# Altium schematic sheet Motor_Driver_Sheet4.SchDoc (part 1 of 2)
size 420 x 297 mm; SheetNumber: 24; SheetTotal: 26
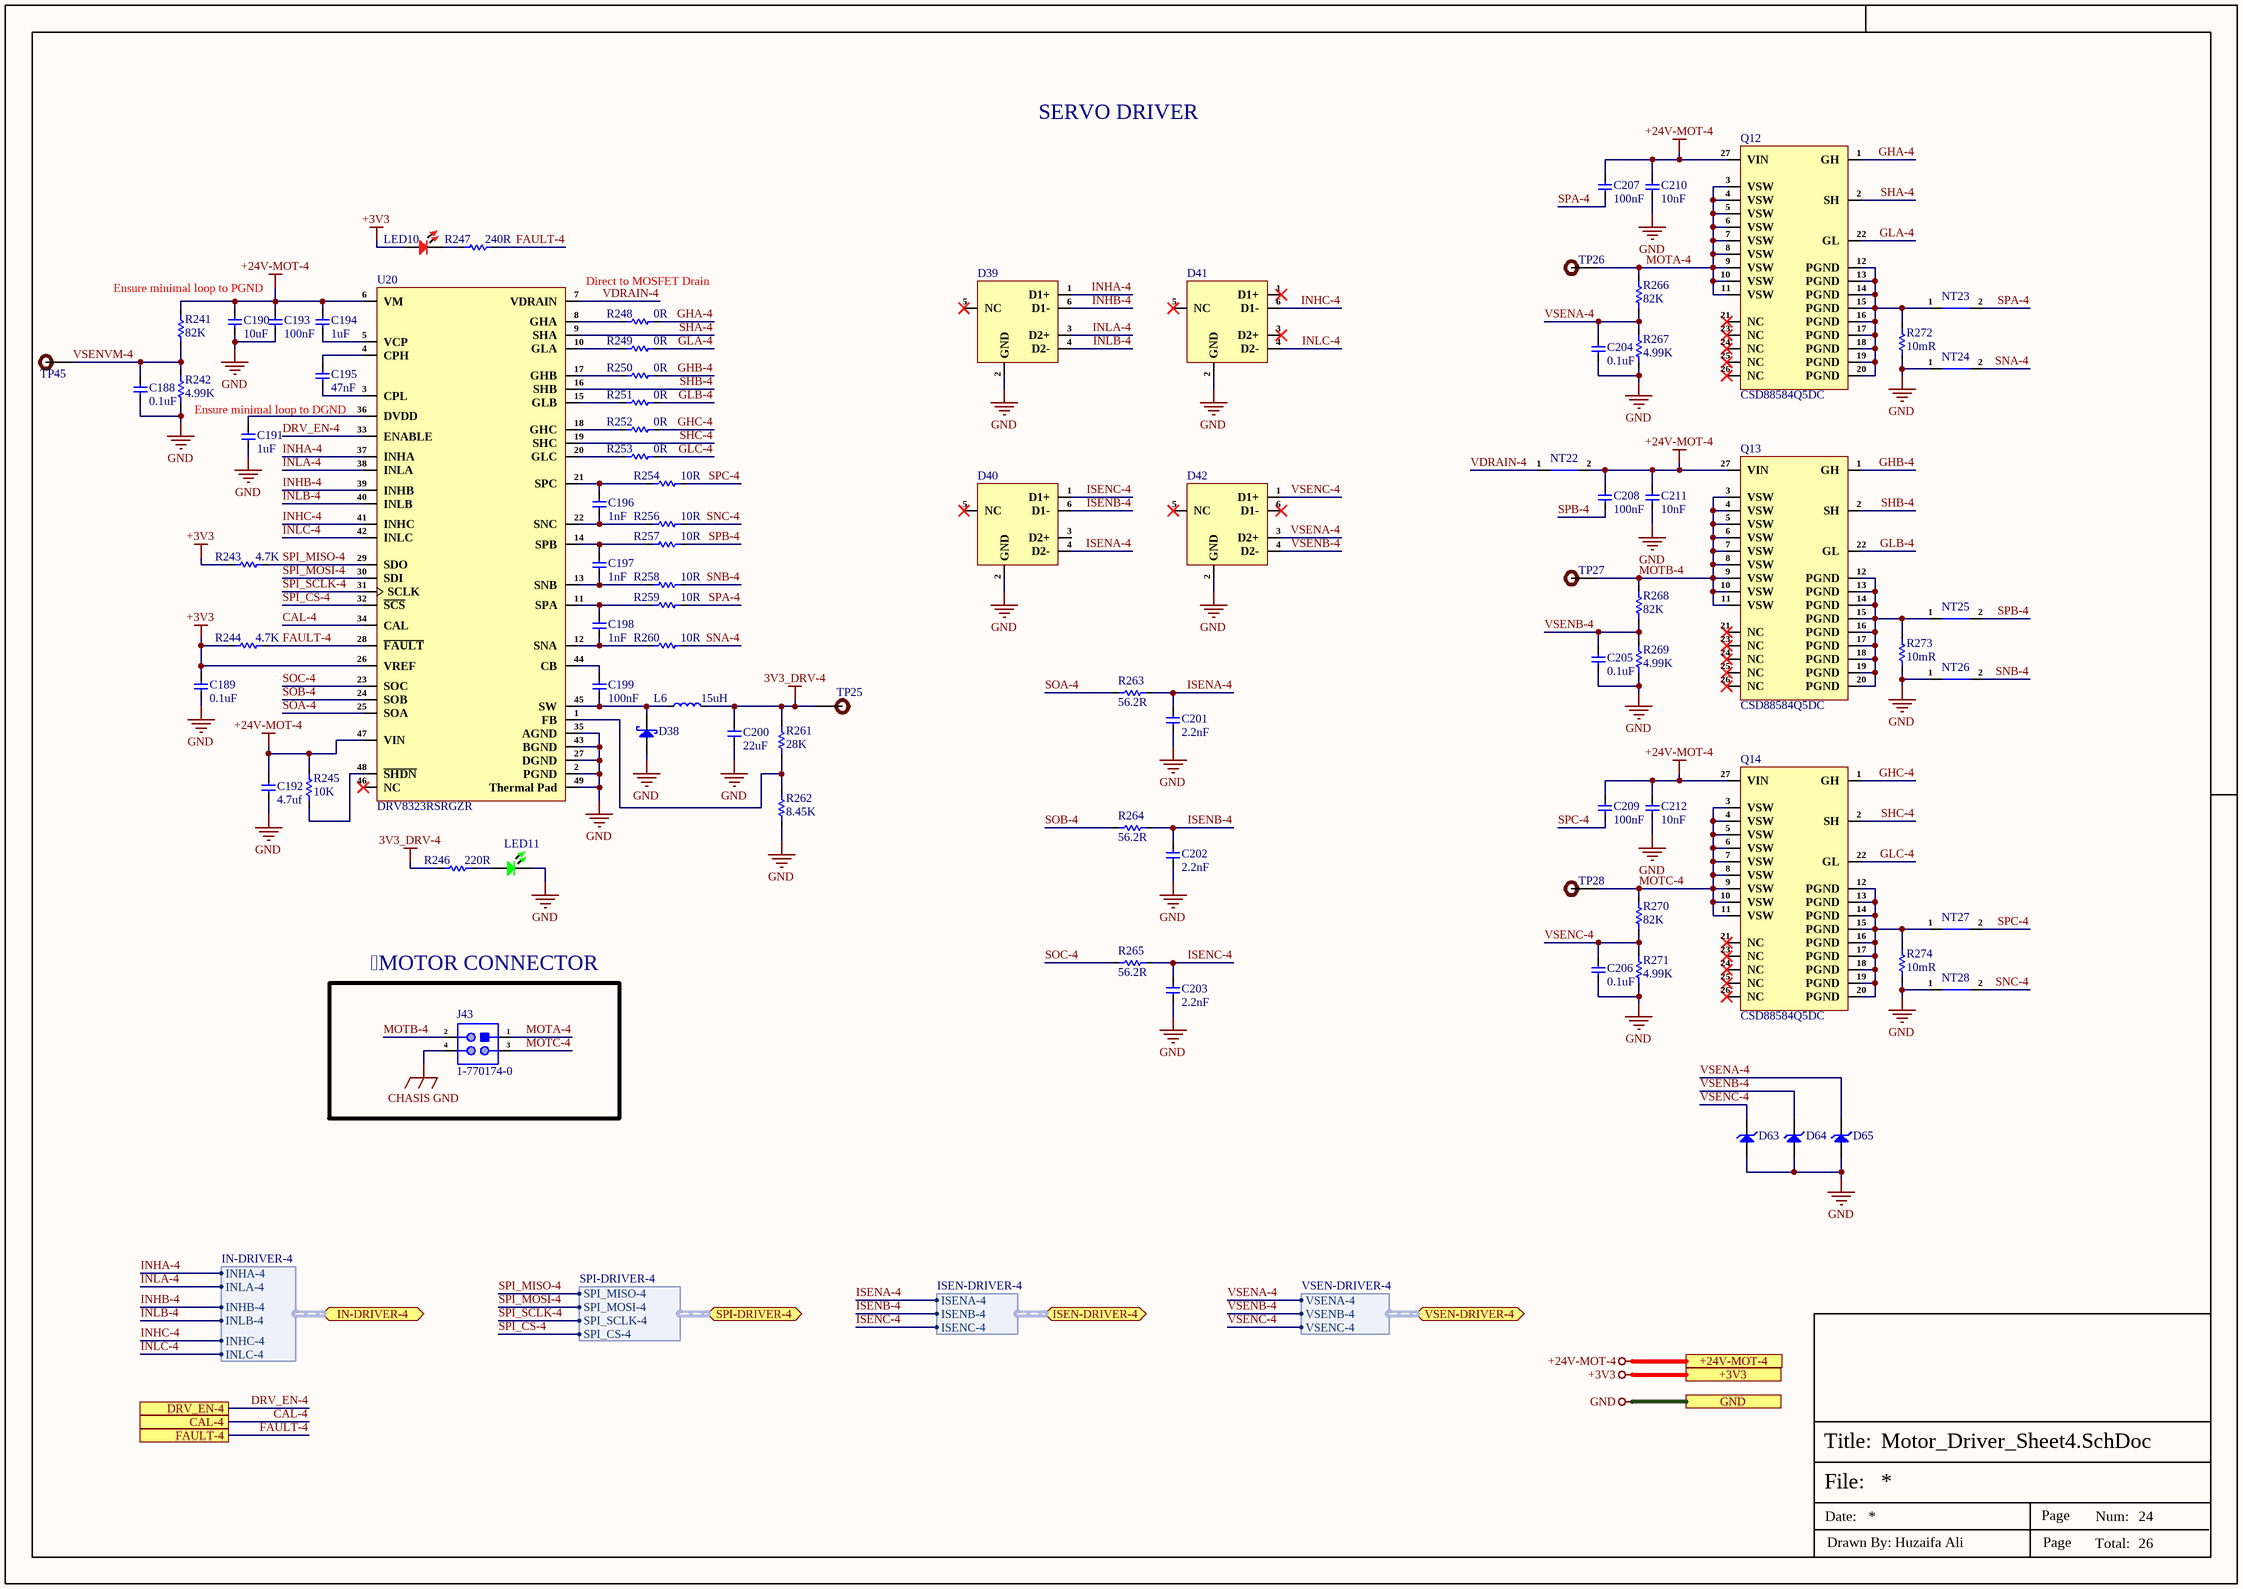
[diagram p0: Motor_Driver_Sheet4.SchDoc]

## Parts
C188  0.1uF  [Cap-0402]
C189  0.1uF  [Cap-0402]
C190  10uF  [Cap-1206]
C191  1uF  [Cap-0603]
C192  4.7uf  [Cap-0805]
C193  100nF  [Cap-0603]
C194  1uF  [Cap-0603]
C195  47nF  [Cap-0402]
C196  1nF  [Cap-0402]
C197  1nF  [Cap-0402]
C198  1nF  [Cap-0402]
C199  100nF  [Cap-0603]
C200  22uF  [Cap-0603]
C201  2.2nF  [Cap-0603]
C202  2.2nF  [Cap-0603]
C203  2.2nF  [Cap-0603]
C204  0.1uF  [Cap-0402]
C205  0.1uF  [Cap-0402]
C206  0.1uF  [Cap-0402]
C207  100nF  [Cap-0603]
C208  100nF  [Cap-0603]
C209  100nF  [Cap-0603]
C210  10nF  [Cap-0402]
C211  10nF  [Cap-0402]
C212  10nF  [Cap-0402]
D38  SS24A  [SMA]  (value not drawn)
D39  TPD4E1U06DCKR  [SOT-363]  (value not drawn)
D40  TPD4E1U06DCKR  [SOT-363]  (value not drawn)
D41  TPD4E1U06DCKR  [SOT-363]  (value not drawn)
D42  TPD4E1U06DCKR  [SOT-363]  (value not drawn)
D63  MM3Z3V3B  [SOD323F]  (value not drawn)
D64  MM3Z3V3B  [SOD323F]  (value not drawn)
D65  MM3Z3V3B  [SOD323F]  (value not drawn)
J43  1-770174-0  [1-770174-0]
L6  15uH  [FEXL0550A-150M]
LED10  RED  [LED-0603]  (value not drawn)
LED11  Emerald  [LED-0603]  (value not drawn)
NT22  Net Tie_SMD  [Net Tie Pad]  (value not drawn)  (net tie, no BOM)
NT23  Net Tie_SMD  [Net Tie Pad]  (value not drawn)  (net tie, no BOM)
NT24  Net Tie_SMD  [Net Tie Pad]  (value not drawn)  (net tie, no BOM)
NT25  Net Tie_SMD  [Net Tie Pad]  (value not drawn)  (net tie, no BOM)
NT26  Net Tie_SMD  [Net Tie Pad]  (value not drawn)  (net tie, no BOM)
NT27  Net Tie_SMD  [Net Tie Pad]  (value not drawn)  (net tie, no BOM)
NT28  Net Tie_SMD  [Net Tie Pad]  (value not drawn)  (net tie, no BOM)
Q12  CSD88584Q5DC  [22-VSON-CLIP (5x6)]
Q13  CSD88584Q5DC  [22-VSON-CLIP (5x6)]
Q14  CSD88584Q5DC  [22-VSON-CLIP (5x6)]
R241  82K  [Res-0603]
R242  4.99K  [Res-0603]
R243  4.7K  [Res-0402]
R244  4.7K  [Res-0402]
R245  10K  [Res-0402]
R246  220R  [Res-0603]
R247  240R  [Res-0402]
R248  0R  [Res-0402]
R249  0R  [Res-0402]
R250  0R  [Res-0402]
R251  0R  [Res-0402]
R252  0R  [Res-0402]
R253  0R  [Res-0402]
R254  10R  [Res-0603]
R256  10R  [Res-0603]
R257  10R  [Res-0603]
R258  10R  [Res-0603]
R259  10R  [Res-0603]
R260  10R  [Res-0603]
R261  28K  [Res-0402]
R262  8.45K  [Res-0402]
R263  56.2R  [Res-0603]
R264  56.2R  [Res-0603]
R265  56.2R  [Res-0603]
R266  82K  [Res-0603]
R267  4.99K  [Res-0603]
R268  82K  [Res-0603]
R269  4.99K  [Res-0603]
R270  82K  [Res-0603]
R271  4.99K  [Res-0603]
R272  10mR  [RES-2512]
R273  10mR  [RES-2512]
R274  10mR  [RES-2512]
TP25  TEST POINT 0.5mm Dia  [Test-point - 0.5mm]  (value not drawn)  (no BOM)
TP26  TEST POINT 0.5mm Dia  [Test-point - 0.5mm]  (value not drawn)  (no BOM)
TP27  TEST POINT 0.5mm Dia  [Test-point - 0.5mm]  (value not drawn)  (no BOM)
TP28  TEST POINT 0.5mm Dia  [Test-point - 0.5mm]  (value not drawn)  (no BOM)
TP45  TEST POINT 0.5mm Dia  [Test-point - 0.5mm]  (value not drawn)  (no BOM)
U20  DRV8323RSRGZR  [48-VQFN (7x7)]

## Ports
+3V3 (see Servo4[2B], CAN_Sheet[4D], Controller_Sheet[5D], DIO_1[5D], DIO_2[5D], DIO_3[5D], DIO_4[5D], Encoder_Sheet1[5D], Encoder_Sheet2[4D], Encoder_Sheet3[4D], Encoder_Sheet4[5D], EtherCAT_Sheet[5D], Motor_Driver_Sheet1[5D], Motor_Driver_Sheet2[5D], Motor_Driver_Sheet3[5D], Power_Sheet[5D], RS485_RS232_Sheet[5D], Sec_Controller_Sheet1[5D], Sec_Controller_Sheet2[5D], Sec_Controller_Sheet3[5D], Sec_Controller_Sheet4[5D], Servo1[5D], Servo2[5D], Servo3[5D], Servo4[5D]), +24V-MOT-4 (see Servo4[2A], Power_Sheet[5D], Servo4[5D]), CAL-4 (see Servo4[2B], Sec_Controller_Sheet4[2D]), DRV_EN-4 (see Servo4[2B], Sec_Controller_Sheet4[2D]), FAULT-4 (see Servo4[2B], Sec_Controller_Sheet4[2D]), GND (see Servo4[2B], CAN_Sheet[4D], Controller_Sheet[5D], DIO_1[5D], DIO_2[5D], DIO_3[5D], DIO_4[5D], Encoder_Sheet1[5D], Encoder_Sheet2[4D], Encoder_Sheet3[4D], Encoder_Sheet4[5D], EtherCAT_Sheet[5D], Motor_Driver_Sheet1[5D], Motor_Driver_Sheet2[5D], Motor_Driver_Sheet3[5D], Power_Sheet[5D], RS485_RS232_Sheet[5D], Sec_Controller_Sheet1[5D], Sec_Controller_Sheet2[5D], Sec_Controller_Sheet3[5D], Sec_Controller_Sheet4[5D], Servo1[5D], Servo2[5D], Servo3[5D], Servo4[5D]), IN-DRIVER-4 (bidir, harness IN-DRIVER-4, see Servo4[2B], Sec_Controller_Sheet4[2C]), ISEN-DRIVER-4 (bidir, harness ISEN-DRIVER-4, see Servo4[2B], Sec_Controller_Sheet4[2D]), SPI-DRIVER-4 (bidir, harness SPI-DRIVER-4, see Servo4[2B], Sec_Controller_Sheet4[2D]), VSEN-DRIVER-4 (bidir, harness VSEN-DRIVER-4, see Servo4[2B], Sec_Controller_Sheet4[3C])

## Harnesses
IN-DRIVER-4: INHA-4, INLA-4, INHB-4, INLB-4, INHC-4, INLC-4
SPI-DRIVER-4: SPI_MISO-4, SPI_MOSI-4, SPI_SCLK-4, SPI_CS-4
ISEN-DRIVER-4: ISENA-4, ISENB-4, ISENC-4
VSEN-DRIVER-4: VSENA-4, VSENB-4, VSENC-4

## Nets
3V3_DRV-4: C200.2 L6.2 R246.1 R261.2 TP25.1
+3V3: C189.2 LED10.1 R243.1 R244.1 U20.26(VREF) ; port +3V3
+24V-MOT-4: C190.2 C192.2 C193.2 C194.2 C207.2 C208.2 C209.2 C210.2 C211.2 C212.2 NT22.2 Q12.27(VIN) Q13.27(VIN) Q14.27(VIN) R241.2 R245.1 U20.6(VM) U20.47(VIN) ; port +24V-MOT-4
CHASIS GND: J43.4
GND: C188.1 C189.1 C190.1 C191.1 C192.1 C193.1 C200.1 C201.1 C202.1 C203.1 C204.1 C205.1 C206.1 C210.1 C211.1 C212.1 D38.2(A) D39.2(GND) D40.2(GND) D41.2(GND) D42.2(GND) D63.1(A) D64.1(A) D65.1(A) LED11.2 NT24.1 NT26.1 NT28.1 R242.1 R262.1 R267.1 R269.1 R271.1 R272.1 R273.1 R274.1 U20.2(PGND) U20.27(DGND) U20.35(AGND) U20.43(BGND) U20.49(Thermal_Pad) ; port GND
CAL-4: U20.34(CAL) ; port CAL-4
DRV_EN-4: U20.33(ENABLE) ; port DRV_EN-4
FAULT-4: R244.2 R247.2 U20.28(~{FAULT}) ; port FAULT-4
GHA-4: Q12.1(GH) R248.2
GHB-4: Q13.1(GH) R250.2
GHC-4: Q14.1(GH) R252.2
GLA-4: Q12.22(GL) R249.2
GLB-4: Q13.22(GL) R251.2
GLC-4: Q14.22(GL) R253.2
INHA-4: D39.1(D1+) U20.37(INHA) ; port IN-DRIVER-4.INHA-4
INHB-4: D39.6(D1-) U20.39(INHB) ; port IN-DRIVER-4.INHB-4
INHC-4: D41.6(D1-) U20.41(INHC) ; port IN-DRIVER-4.INHC-4
INLA-4: D39.3(D2+) U20.38(INLA) ; port IN-DRIVER-4.INLA-4
INLB-4: D39.4(D2-) U20.40(INLB) ; port IN-DRIVER-4.INLB-4
INLC-4: D41.4(D2-) U20.42(INLC) ; port IN-DRIVER-4.INLC-4
ISENA-4: C201.2 D40.4(D2-) R263.2 ; port ISEN-DRIVER-4.ISENA-4
ISENB-4: C202.2 D40.6(D1-) R264.2 ; port ISEN-DRIVER-4.ISENB-4
ISENC-4: C203.2 D40.1(D1+) R265.2 ; port ISEN-DRIVER-4.ISENC-4
MOTA-4: J43.1 Q12.3(VSW) Q12.4(VSW) Q12.5(VSW) Q12.6(VSW) Q12.7(VSW) Q12.8(VSW) Q12.9(VSW) Q12.10(VSW) Q12.11(VSW) R266.2 TP26.1
MOTB-4: J43.2 Q13.3(VSW) Q13.4(VSW) Q13.5(VSW) Q13.6(VSW) Q13.7(VSW) Q13.8(VSW) Q13.9(VSW) Q13.10(VSW) Q13.11(VSW) R268.2 TP27.1
MOTC-4: J43.3 Q14.3(VSW) Q14.4(VSW) Q14.5(VSW) Q14.6(VSW) Q14.7(VSW) Q14.8(VSW) Q14.9(VSW) Q14.10(VSW) Q14.11(VSW) R270.2 TP28.1
SHA-4: Q12.2(SH) U20.9(SHA)
SHB-4: Q13.2(SH) U20.16(SHB)
SHC-4: Q14.2(SH) U20.19(SHC)
SNA-4: NT24.2 R260.2
SNB-4: NT26.2 R258.2
SNC-4: NT28.2 R256.2
SOA-4: R263.1 U20.25(SOA)
SOB-4: R264.1 U20.24(SOB)
SOC-4: R265.1 U20.23(SOC)
SPA-4: C207.1 NT23.2 R259.2
SPB-4: C208.1 NT25.2 R257.2
SPC-4: C209.1 NT27.2 R254.2
SPI_CS-4: U20.32(~{SCS}) ; port SPI-DRIVER-4.SPI_CS-4
SPI_MISO-4: R243.2 U20.29(SDO) ; port SPI-DRIVER-4.SPI_MISO-4
SPI_MOSI-4: U20.30(SDI) ; port SPI-DRIVER-4.SPI_MOSI-4
SPI_SCLK-4: U20.31(SCLK) ; port SPI-DRIVER-4.SPI_SCLK-4
VDRAIN-4: NT22.1 U20.7(VDRAIN)
VSENA-4: C204.2 D42.3(D2+) D65.2(K) R266.1 R267.2 ; port VSEN-DRIVER-4.VSENA-4
VSENB-4: C205.2 D42.4(D2-) D64.2(K) R268.1 R269.2 ; port VSEN-DRIVER-4.VSENB-4
VSENC-4: C206.2 D42.1(D1+) D63.2(K) R270.1 R271.2 ; port VSEN-DRIVER-4.VSENC-4
VSENVM-4: C188.2 R241.1 R242.2 TP45.1
NetC191_2: C191.2 U20.36(DVDD)
NetC194_1: C194.1 U20.5(VCP)
NetC195_1: C195.1 U20.3(CPL)
NetC195_2: C195.2 U20.4(CPH)
NetC196_1: C196.1 R256.1 U20.22(SNC)
NetC196_2: C196.2 R254.1 U20.21(SPC)
NetC197_1: C197.1 R258.1 U20.13(SNB)
NetC197_2: C197.2 R257.1 U20.14(SPB)
NetC198_1: C198.1 R260.1 U20.12(SNA)
NetC198_2: C198.2 R259.1 U20.11(SPA)
NetC199_1: C199.1 D38.1(K) L6.1 U20.45(SW)
NetC199_2: C199.2 U20.44(CB)
NetLED10_2: LED10.2 R247.1
NetLED11_1: LED11.1 R246.2
NetNT23_1: NT23.1 Q12.12(PGND) Q12.13(PGND) Q12.14(PGND) Q12.15(PGND) Q12.16(PGND) Q12.17(PGND) Q12.18(PGND) Q12.19(PGND) Q12.20(PGND) R272.2
NetNT25_1: NT25.1 Q13.12(PGND) Q13.13(PGND) Q13.14(PGND) Q13.15(PGND) Q13.16(PGND) Q13.17(PGND) Q13.18(PGND) Q13.19(PGND) Q13.20(PGND) R273.2
NetNT27_1: NT27.1 Q14.12(PGND) Q14.13(PGND) Q14.14(PGND) Q14.15(PGND) Q14.16(PGND) Q14.17(PGND) Q14.18(PGND) Q14.19(PGND) Q14.20(PGND) R274.2
NetR245_2: R245.2 U20.48(~{SHDN})
NetR248_1: R248.1 U20.8(GHA)
NetR249_1: R249.1 U20.10(GLA)
NetR250_1: R250.1 U20.17(GHB)
NetR251_1: R251.1 U20.15(GLB)
NetR252_1: R252.1 U20.18(GHC)
NetR253_1: R253.1 U20.20(GLC)
NetR261_1: R261.1 R262.2 U20.1(FB)

Not connected (* = marked no-connect by the designer): D39 5(NC)*; D40 3(D2+) 5(NC)*; D41 1(D1+)* 3(D2+)* 5(NC)*; D42 5(NC)* 6(D1-)*; Q12 21(NC)* 23(NC)* 24(NC)* 25(NC)* 26(NC)*; Q13 21(NC)* 23(NC)* 24(NC)* 25(NC)* 26(NC)*; Q14 21(NC)* 23(NC)* 24(NC)* 25(NC)* 26(NC)*; U20 46(NC)*

## Notes on the sheet
- SERVO DRIVER
- Ensure minimal loop to PGND
- Direct to MOSFET Drain
- Ensure minimal loop to DGND
- MOTOR CONNECTOR
- File:
- Title:
- Date:
- Page
- Num:
- Total:
- Drawn By: Huzaifa Ali